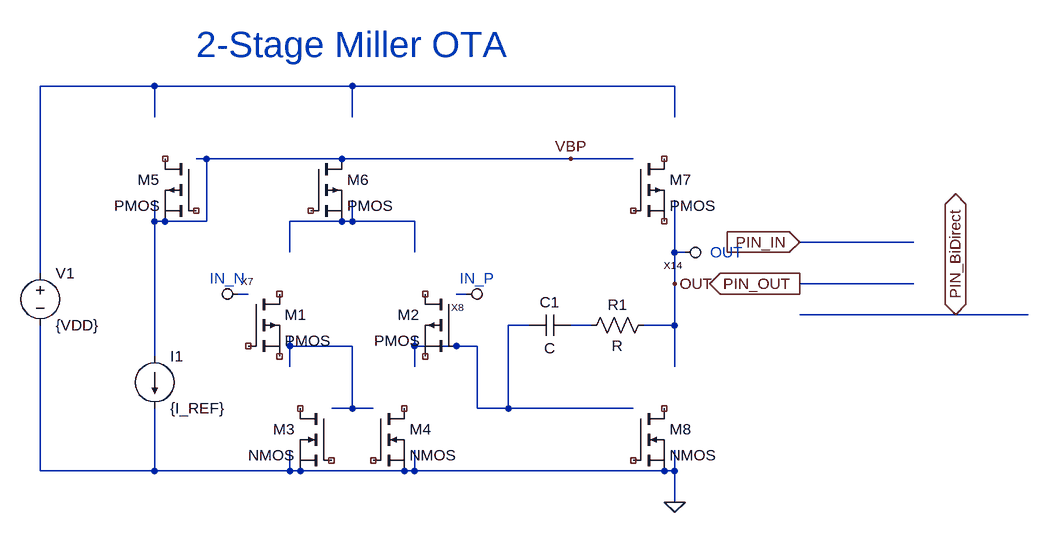
[diagram p0: schematic miller_ota.asc]
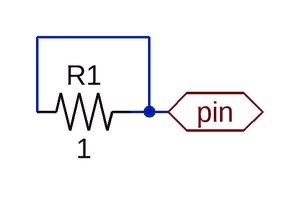
[diagram p1: sub-circuit pin.asc]
miller_ota.asc, the LTspice schematic file:
Version 4
SHEET 1 1316 760
WIRE -32 16 -208 16
WIRE 272 16 -32 16
WIRE 768 16 272 16
WIRE -32 64 -32 16
WIRE 272 64 272 16
WIRE 768 64 768 16
WIRE 48 128 32 128
WIRE 208 128 48 128
WIRE 608 128 208 128
WIRE 704 128 608 128
WIRE -32 224 -32 192
WIRE 48 224 48 128
WIRE 48 224 -32 224
WIRE 272 224 272 192
WIRE 272 224 176 224
WIRE 368 224 272 224
WIRE 1136 256 960 256
WIRE 176 272 176 224
WIRE 368 272 368 224
WIRE 768 272 768 192
WIRE 784 272 768 272
WIRE -208 304 -208 16
WIRE 768 320 768 272
WIRE 1136 320 960 320
WIRE 112 336 96 336
WIRE 448 336 432 336
WIRE 1200 368 960 368
WIRE 1312 368 1200 368
WIRE 544 384 512 384
WIRE 640 384 608 384
WIRE 768 384 768 320
WIRE 768 384 720 384
WIRE 176 416 176 400
WIRE 272 416 176 416
WIRE 368 416 368 400
WIRE 464 416 368 416
WIRE -32 432 -32 224
WIRE 176 448 176 416
WIRE 368 448 368 416
WIRE 768 448 768 384
WIRE 272 512 272 416
WIRE 272 512 240 512
WIRE 304 512 272 512
WIRE 464 512 464 416
WIRE 512 512 512 384
WIRE 512 512 464 512
WIRE 704 512 512 512
WIRE -208 608 -208 384
WIRE -32 608 -32 512
WIRE -32 608 -208 608
WIRE 176 608 176 576
WIRE 176 608 -32 608
WIRE 368 608 368 576
WIRE 368 608 176 608
WIRE 768 608 768 576
WIRE 768 608 368 608
WIRE 768 656 768 608
FLAG 768 656 0
FLAG 960 256 PIN_IN
IOPIN 960 256 In
FLAG 960 320 PIN_OUT
IOPIN 960 320 Out
FLAG 1200 368 PIN_BiDirect
IOPIN 1200 368 BiDir
FLAG 608 128 VBP
FLAG 768 320 OUT
SYMBOL pin 96 336 R0
SYMATTR InstName X7
SYMBOL pin 448 336 R180
SYMATTR InstName X8
SYMBOL pin 784 272 R180
SYMATTR InstName X14
SYMBOL nmos 704 512 R0
SYMATTR InstName M8
SYMBOL pmos 112 336 R0
SYMATTR InstName M1
SYMBOL pmos 432 336 M0
SYMATTR InstName M2
SYMBOL nmos 304 512 R0
SYMATTR InstName M4
SYMBOL nmos 240 512 M0
SYMATTR InstName M3
SYMBOL pmos 32 128 M0
SYMATTR InstName M5
SYMBOL pmos 208 128 R0
SYMATTR InstName M6
SYMBOL pmos 704 128 R0
SYMATTR InstName M7
SYMBOL Voltage -208 288 R0
SYMATTR InstName V1
SYMATTR Value {VDD}
SYMBOL current -32 432 R0
SYMATTR InstName I1
SYMATTR Value {I_REF}
SYMBOL cap 608 368 R90
WINDOW 0 -4 32 VBottom 2
WINDOW 3 36 32 VTop 2
SYMATTR InstName C1
SYMBOL res 736 368 R90
WINDOW 0 0 56 VBottom 2
WINDOW 3 32 56 VTop 2
SYMATTR InstName R1
TEXT 848 272 Center 2 ;OUT
TEXT 464 312 Center 2 ;IN_P
TEXT 80 312 Center 2 ;IN_N
TEXT 272 -48 Center 5 ;2-Stage Miller OTA

pin.asc, the sub-circuit schematic file:
Version 4
SHEET 1 880 680
WIRE 32 160 -64 160
WIRE -64 224 -64 160
WIRE 32 224 32 160
WIRE 32 224 16 224
WIRE 48 224 32 224
FLAG 48 224 pin
IOPIN 48 224 BiDir
SYMBOL res 32 208 R90
WINDOW 0 0 56 VBottom 2
WINDOW 3 32 56 VTop 2
SYMATTR InstName R1
SYMATTR Value 1

The netlist it stands for:
* miller_ota.asc
XX7 N003 pin
XX8 N004 pin
XX14 OUT pin
* M8: NMOS (symbol nmos not certain, pin order unknown); nets seen at it: 0
* M1: PMOS (symbol pmos not certain, pin order unknown); nets seen at it: 
* M2: PMOS (symbol pmos not certain, pin order unknown); nets seen at it: N005
* M4: NMOS (symbol nmos not certain, pin order unknown); nets seen at it: 0
* M3: NMOS (symbol nmos not certain, pin order unknown); nets seen at it: 0
* M5: PMOS (symbol pmos not certain, pin order unknown); nets seen at it: VBP
M6 VBP NC_14 N002 N002 PMOS
* M7: PMOS (symbol pmos not certain, pin order unknown); nets seen at it: 
V1 N001 0 {VDD}
I1 VBP 0 {I_REF}
C1 N006 N005 C
R1 OUT N006 R

* block symbol definitions
.subckt pin pin
R1 pin pin 1
.ends pin

.model NMOS NMOS
.model PMOS PMOS
.lib standard.mos
* OUT
* IN_P
* IN_N
* 2-Stage Miller OTA
.backanno
.end